# EasyEDA Pro project trumpx-ipadrescreen-ipad34-c6ab9950.epro, schematic SCH_B
Board Name: IPAD3_4_Display_Board; Create Date: 2025-06-30; Page Name: P1; Project Name: IPADRESCREEN_IPAD3/4便携屏改造计划; Schematic Name: SCH_B; Update Date: 2025-06-30; Company: BSUIC; Page Size: A4; Version: V1.1
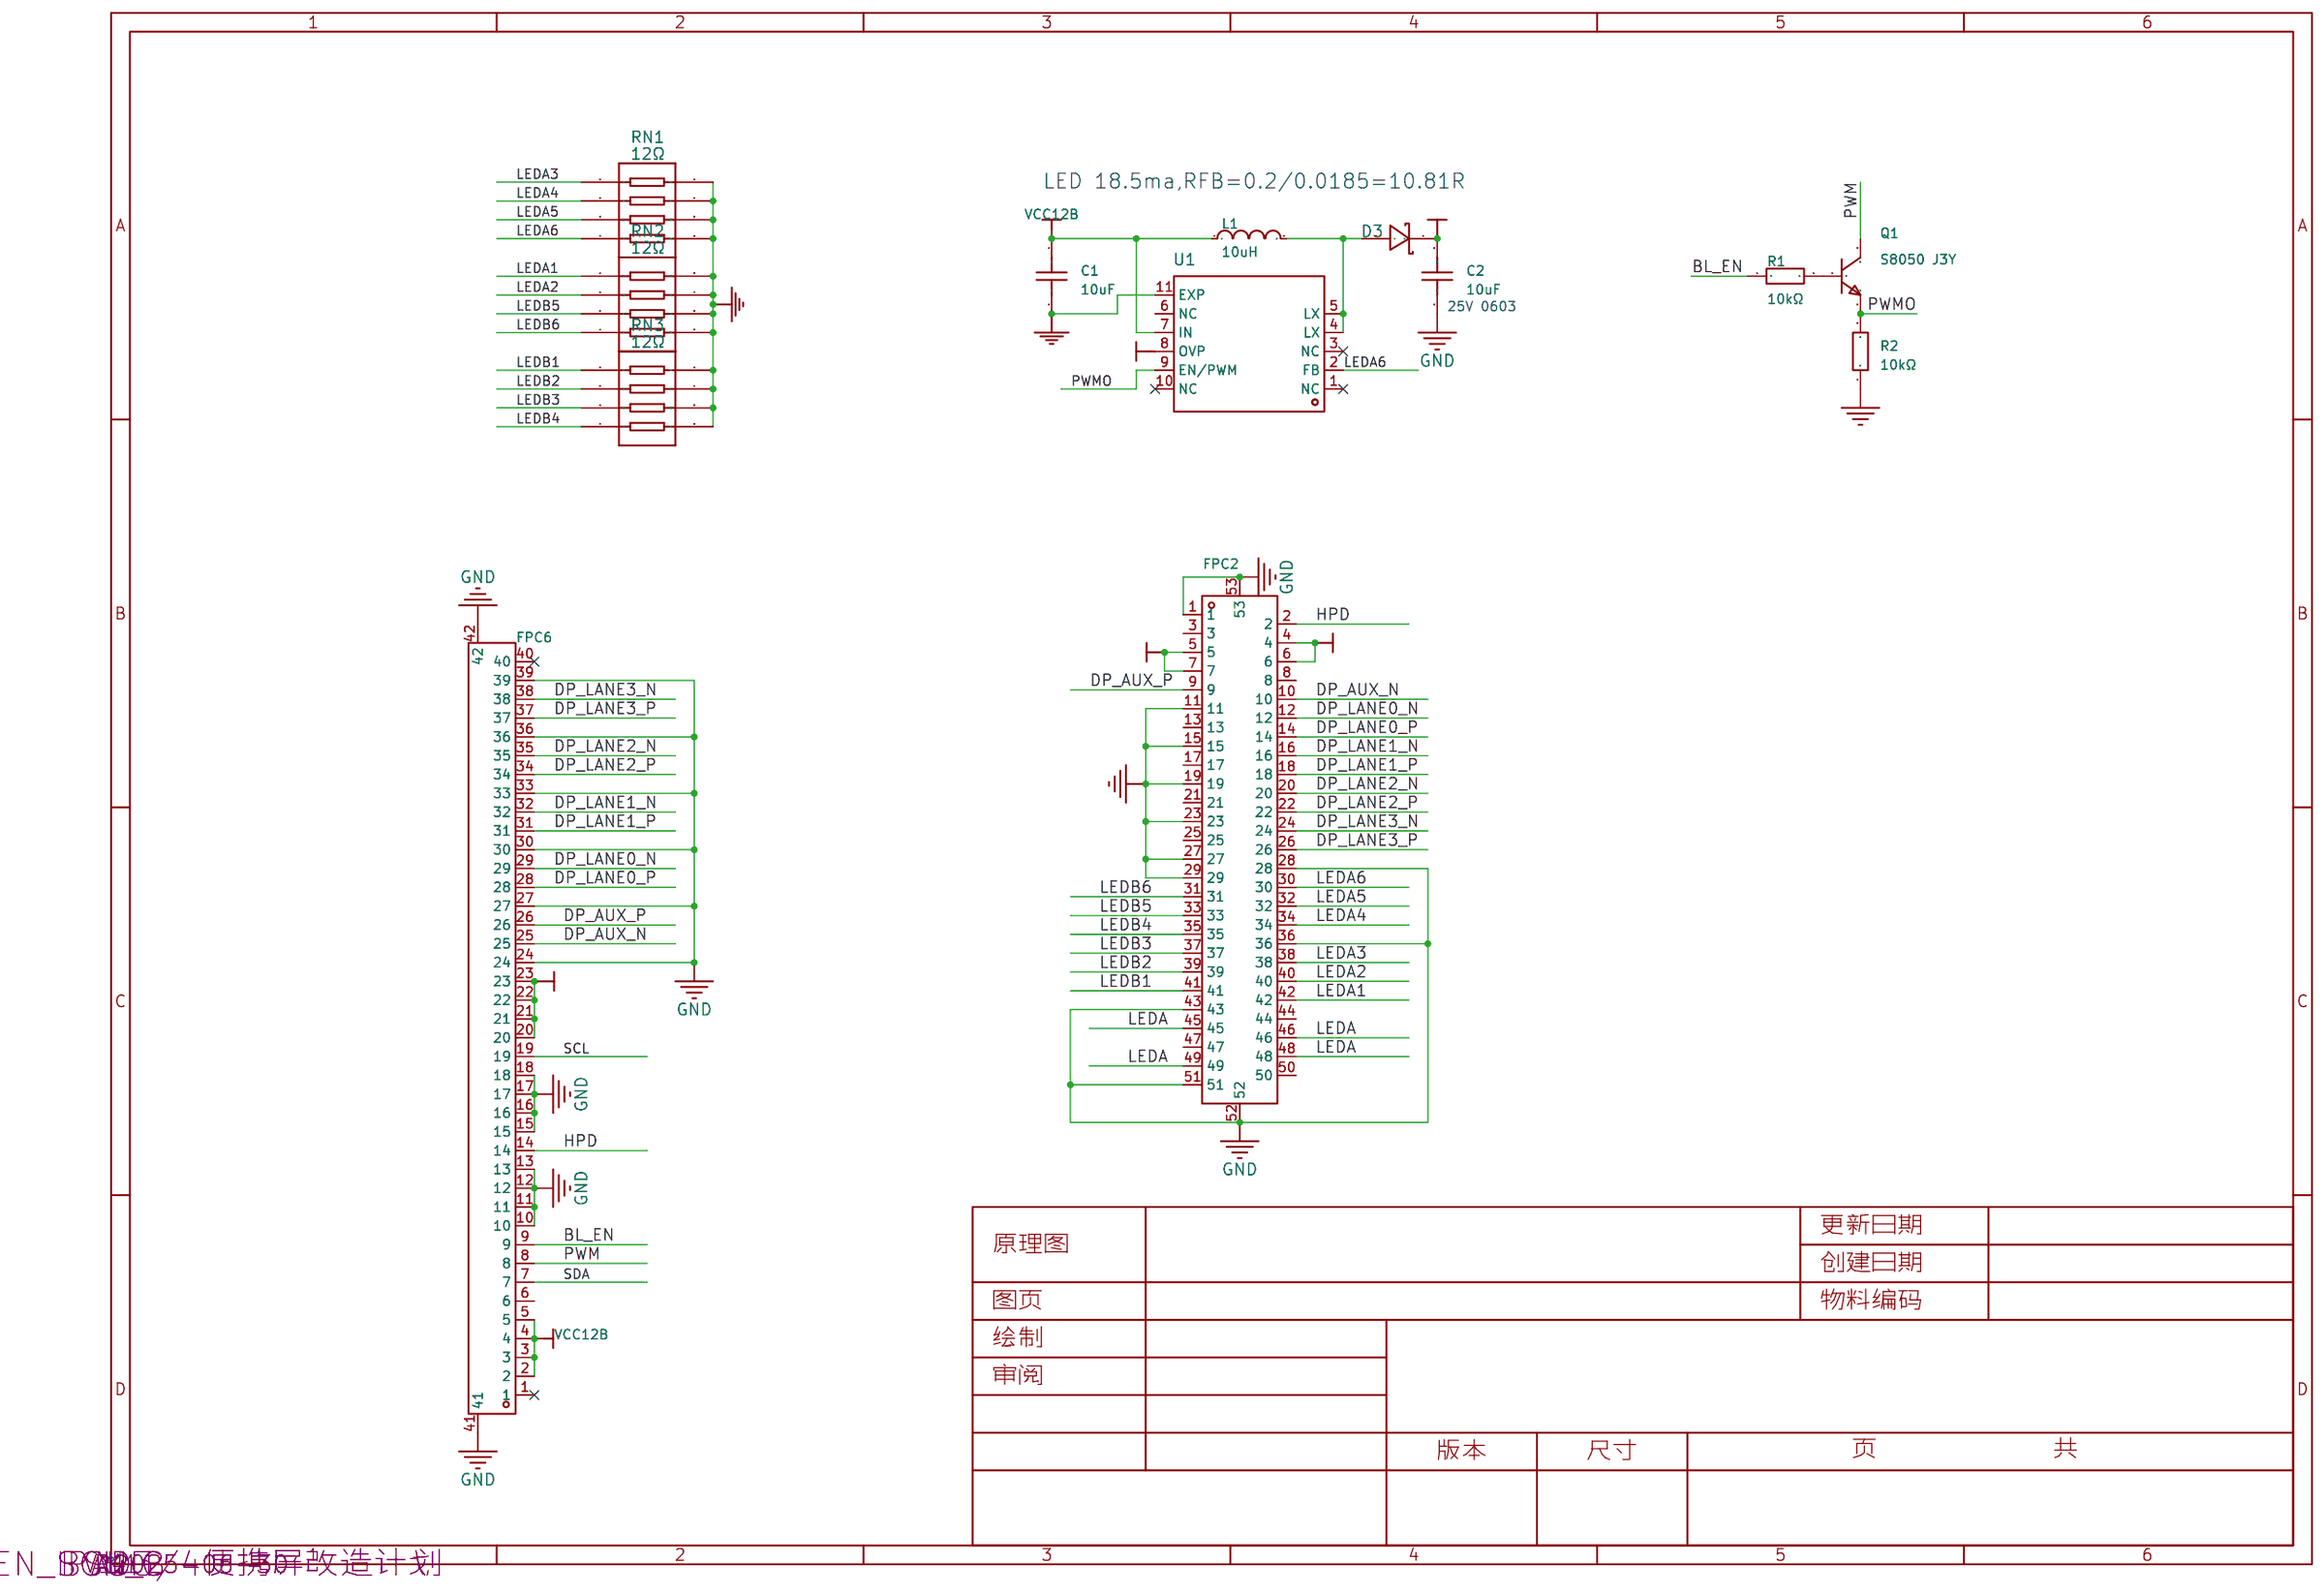
[diagram p4: schematic sheet]

## Parts
C1  10uF  [C0805]
C2  10uF  [C0805]
D3  SS34_C8678  [DO-214AC_L4.3-W2.7-LS5.3-RD]
FPC2  -  [FPC-IPAD3-TB]
FPC6  X05A15L40T  [FFC-SMD_40P-P0.50_XKB_X05A15L40T]
L1  10uH  [IND-SMD_L7.1-W6.6]
Q1  S8050 J3Y  [SOT-23-3_L3.0-W1.7-P0.95-LS2.9-BR]
R1  10kΩ  [R0603]
R2  10kΩ  [R0603]
RN1  12Ω  [RES-ARRAY-SMD_0603-8P-L3.2-W1.6-BL]
RN2  12Ω  [RES-ARRAY-SMD_0603-8P-L3.2-W1.6-BL]
RN3  12Ω  [RES-ARRAY-SMD_0603-8P-L3.2-W1.6-BL]
U1  SY7203DBC  [DFN-10_L3.0-W3.0-P0.50-BL-EP]

## Library data of the parts
C1 C2 = CL21A106KAYNNNE_C15850: 容值:10uF;精度:±10%;额定电压:25V;材质(温度系数):X5R;; LCSC Part Name: 10uF ±10% 25V; Supplier Part: C15850; Manufacturer: SAMSUNG(三星); Manufacturer Part: CL21A106KAYNNNE; Supplier Footprint: 0805; JLCPCB Part Class: 基础库; Datasheet: https://atta.szlcsc.com/upload/public/pdf/source/20160218/1457707763339.pdf; Supplier: LCSC; Tolerance: ±10%; Voltage Rated: 25V; Temperature Coefficient: X5R
D3 = SS34: Supplier: LCSC; Manufacturer: MDD; Supplier Part: C8678; JLCPCB Part Class: Basic Part
FPC2 = FPC-IPAD3-TB
FPC6 = X05A15L40T: 间距:0.5mm;触点数量:40;锁定特性:翻盖式;安装类型:卧贴;触点类型:下接;工作温度范围:-25℃~+85℃;焊接温度(最大值):260℃;; LCSC Part Name: 0.5mm P数:40 翻盖式 下接; Supplier Part: C2879928; Manufacturer: XKB Connectivity(中国星坤); Supplier Footprint: SMD,P=0.5mm; JLCPCB Part Class: Extended Part; Datasheet: https://atta.szlcsc.com/upload/public/pdf/source/20210903/5A66098E82FCF581030536131EA1B4CD.pdf; Supplier: LCSC; Pitch: 0.5mm; Number of Contacts: 40; Locking Feature: 翻盖式; Mounting Type: 卧贴; Contact Type: 下接; Height Above Board: 1.5mm; FFC, FCB Thickness: 0.3mm; Contact Material: 铜合金; Contact Plating: 锡; Operating Temperature Range: -25℃~+85℃; Welding Temperature (Max): 260℃
L1 = APH0630T100M: 电感值:10uH;精度:±20%;额定电流:3.91A;饱和电流(Isat):4.57A;类型:一体成型电感;; LCSC Part Name: 10uH ±20% 4.57A; Supplier Part: C5349698; Manufacturer: APV(爱普微); Supplier Footprint: SMD,7x6.6mm; JLCPCB Part Class: 扩展库; Datasheet: https://atta.szlcsc.com/upload/public/pdf/source/20230920/8DF4F91CA8787177DE496A10F73889DA.pdf; Supplier: LCSC; Tolerance: ±20%; Rated Current: 3.91A; Saturation Current (Isat): 4.57A; DC Resistance (DCR): 68mΩ; Type: 一体成型电感
Q1 = S8050 J3Y(RANGE:200-350): 晶体管类型:NPN;集电极电流(Ic):500mA;集射极击穿电压(Vceo):25V;耗散功率(Pd):300mW;直流电流增益(hFE):200@500mA,1V;; LCSC Part Name: H档(200-350); Supplier Part: C2146; Manufacturer: CJ(江苏长电/长晶); Supplier Footprint: SOT-23; JLCPCB Part Class: 基础库; Datasheet: https://atta.szlcsc.com/upload/public/pdf/source/20231013/FF37B6A000E6CDA75C9C999D2E78731F.pdf; Supplier: LCSC; type: NPN; Current - Collector(Ic): 500mA; Collector - Emitter Voltage VCEO: 25V; Pd - Power Dissipation: 300mW; DC Current Gain: 200@500mA,1V; Transition frequency(fT): 150MHz; Current - Collector Cutoff: 100nA; Vce Saturation(VCE(sat)): 600mV; Operating Temperature: -55℃~+150℃
R1 R2 = 0603WAF1002T5E: 电阻类型:厚膜电阻;阻值:10kΩ;精度:±1%;功率:100mW;最大工作电压:75V;温度系数:±100ppm/℃;; LCSC Part Name: 厚膜电阻 10kΩ ±1% 100mW; Supplier Part: C25804; Manufacturer: UNI-ROYAL(厚声); Supplier Footprint: 0603; JLCPCB Part Class: 基础库; Datasheet: https://atta.szlcsc.com/upload/public/pdf/source/20200306/C422600_1E6D84923E4A46A82E41ADD87F860B5C.pdf; Supplier: LCSC; Type: 厚膜电阻; Tolerance: ±1%; Power(Watts): 100mW; Overload Voltage (Max): 75V; Temperature Coefficient: ±100ppm/℃; Operating Temperature Range: -55℃~+155℃
RN1-RN3 = 4D03WGJ0120T5E: Supplier: LCSC; Manufacturer: UniOhm; Resistance: 12; Supplier Part: C11994; JLCPCB Part Class: Extended Part
U1 = SY7203DBC: Supplier: LCSC; Manufacturer: Silergy; Supplier Part: C125894; JLCPCB Part Class: Extended Part

## Nets
GND: C1.1 C2.1 FPC2.1 FPC2.11 FPC2.15 FPC2.19 FPC2.23 FPC2.27 FPC2.28 FPC2.29 FPC2.36 FPC2.43 FPC2.51 FPC2.52 FPC2.53 FPC6.10 FPC6.11 FPC6.12 FPC6.13 FPC6.15 FPC6.16 FPC6.17 FPC6.18 FPC6.24 FPC6.27 FPC6.30 FPC6.33 FPC6.36 FPC6.39 FPC6.41 FPC6.42 R2.1 RN1.5 RN1.6 RN1.7 RN1.8 RN2.5 RN2.6 RN2.7 RN2.8 RN3.5 RN3.6 RN3.7 RN3.8 U1.11(EXP)
VCC3.3: FPC2.4 FPC2.5 FPC2.6 FPC2.7 FPC6.20 FPC6.21 FPC6.22 FPC6.23
VCC12B: C1.2 FPC6.2 FPC6.3 FPC6.4 FPC6.5 L1.1 U1.7(IN)
BL_EN: FPC6.9 R1.1
DP_AUX_N: FPC2.10 FPC6.25
DP_AUX_P: FPC2.9 FPC6.26
DP_LANE0_N: FPC2.12 FPC6.29
DP_LANE0_P: FPC2.14 FPC6.28
DP_LANE1_N: FPC2.16 FPC6.32
DP_LANE1_P: FPC2.18 FPC6.31
DP_LANE2_N: FPC2.20 FPC6.35
DP_LANE2_P: FPC2.22 FPC6.34
DP_LANE3_N: FPC2.24 FPC6.38
DP_LANE3_P: FPC2.26 FPC6.37
HPD: FPC2.2 FPC6.14
LEDA: C2.2 D3.1(K) FPC2.45 FPC2.46 FPC2.48 FPC2.49 U1.8(OVP)
LEDA1: FPC2.42 RN2.1
LEDA2: FPC2.40 RN2.2
LEDA3: FPC2.38 RN1.1
LEDA4: FPC2.34 RN1.2
LEDA5: FPC2.32 RN1.3
LEDA6: FPC2.30 RN1.4 U1.2(FB)
LEDB1: FPC2.41 RN3.1
LEDB2: FPC2.39 RN3.2
LEDB3: FPC2.37 RN3.3
LEDB4: FPC2.35 RN3.4
LEDB5: FPC2.33 RN2.3
LEDB6: FPC2.31 RN2.4
PWM: FPC6.8 Q1.3(C)
PWMO: Q1.2(E) R2.2 U1.9(EN/PWM)
SCL: FPC6.19
SDA: FPC6.7
$1N26772: D3.2(A) L1.2 U1.4(LX) U1.5(LX)
$1N32535: Q1.1(B) R1.2

Not connected (* = marked no-connect by the designer): FPC2 3 8 13 17 21 25 44 47 50; FPC6 1* 6 40*; U1 1(NC)* 3(NC)* 6(NC) 10(NC)*

## Notes on the sheet
- LED 18.5ma,RFB=0.2/0.0185=10.81R
- 25V 0603
